# Altium schematic sheet Solenoid-Sheet.SchDoc
size 420 x 297 mm; SheetNumber: 5; SheetTotal: 5
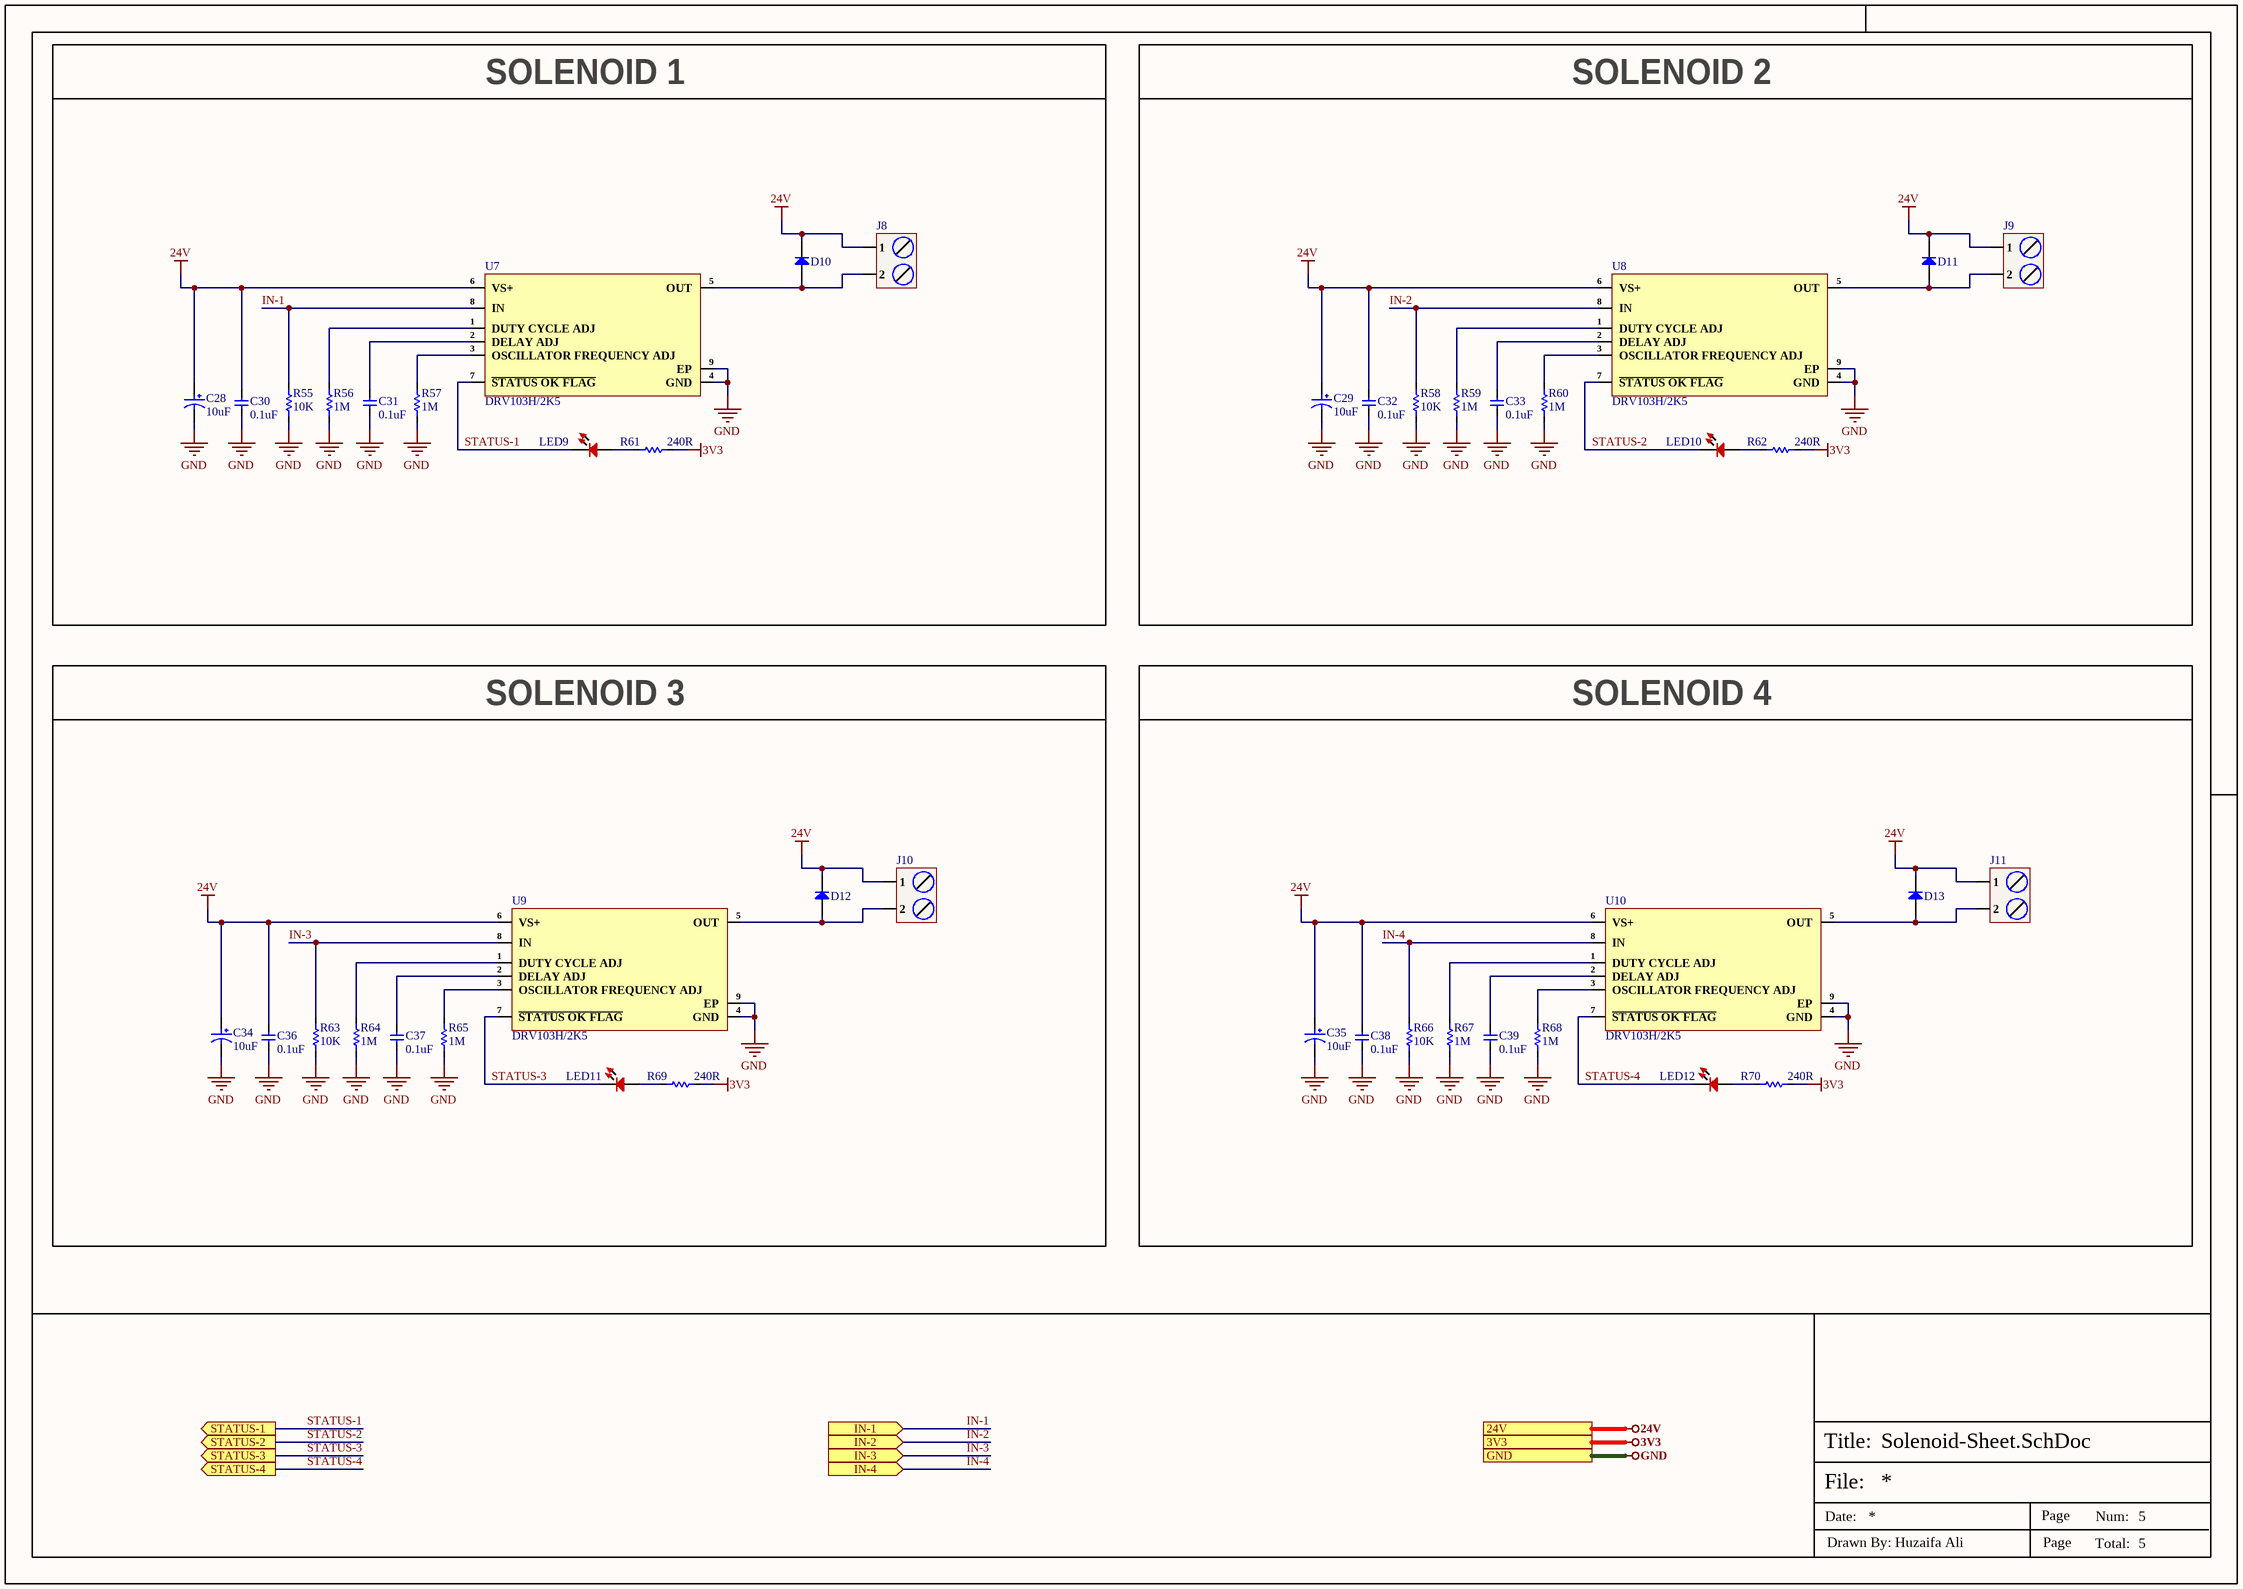
[diagram p0: Solenoid-Sheet.SchDoc]

## Parts
C28  10uF  [50SVPF10M]
C29  10uF  [50SVPF10M]
C30  0.1uF  [Cap-0603]
C31  0.1uF  [Cap-0603]
C32  0.1uF  [Cap-0603]
C33  0.1uF  [Cap-0603]
C34  10uF  [50SVPF10M]
C35  10uF  [50SVPF10M]
C36  0.1uF  [Cap-0603]
C37  0.1uF  [Cap-0603]
C38  0.1uF  [Cap-0603]
C39  0.1uF  [Cap-0603]
D10  MURS360T3G  [SMC]  (value not drawn)
D11  MURS360T3G  [SMC]  (value not drawn)
D12  MURS360T3G  [SMC]  (value not drawn)
D13  MURS360T3G  [SMC]  (value not drawn)
J8  DB128L-5.08-2P-GY-S  [DB128L-5.08-2P-GY-S]  (value not drawn)
J9  DB128L-5.08-2P-GY-S  [DB128L-5.08-2P-GY-S]  (value not drawn)
J10  DB128L-5.08-2P-GY-S  [DB128L-5.08-2P-GY-S]  (value not drawn)
J11  DB128L-5.08-2P-GY-S  [DB128L-5.08-2P-GY-S]  (value not drawn)
LED9  RED  [LED-0603]  (value not drawn)
LED10  RED  [LED-0603]  (value not drawn)
LED11  RED  [LED-0603]  (value not drawn)
LED12  RED  [LED-0603]  (value not drawn)
R55  10K  [Res-0402]
R56  1M  [Res-0402]
R57  1M  [Res-0402]
R58  10K  [Res-0402]
R59  1M  [Res-0402]
R60  1M  [Res-0402]
R61  240R  [Res-0402]
R62  240R  [Res-0402]
R63  10K  [Res-0402]
R64  1M  [Res-0402]
R65  1M  [Res-0402]
R66  10K  [Res-0402]
R67  1M  [Res-0402]
R68  1M  [Res-0402]
R69  240R  [Res-0402]
R70  240R  [Res-0402]
U7  DRV103H/2K5  [8-SO PowerPad]
U8  DRV103H/2K5  [8-SO PowerPad]
U9  DRV103H/2K5  [8-SO PowerPad]
U10  DRV103H/2K5  [8-SO PowerPad]

## Blocks framed on the sheet
SOLENOID 1: C28 C30 C31 D10 J8 LED9 R55-R57 R61 U7
SOLENOID 2: C29 C32 C33 D11 J9 LED10 R58-R60 R62 U8
SOLENOID 3: C34 C36 C37 D12 J10 LED11 R63-R65 R69 U9
SOLENOID 4: C35 C38 C39 D13 J11 LED12 R66-R68 R70 U10

## Ports
3V3 (see Top-Sheet[5B], Comms-Sheet[4D], Controller-Sheet[4D], Power-Sheet[4D]), 24V (see Top-Sheet[5B], Power-Sheet[4D]), GND (see Top-Sheet[5B], Comms-Sheet[4D], Controller-Sheet[4D], Power-Sheet[4D]), IN-1 (in, see Top-Sheet[4B]), IN-2 (in, see Top-Sheet[4B]), IN-3 (in, see Top-Sheet[4B]), IN-4 (in, see Top-Sheet[4B]), STATUS-1 (out, see Top-Sheet[4B]), STATUS-2 (out, see Top-Sheet[4B]), STATUS-3 (out, see Top-Sheet[4B]), STATUS-4 (out, see Top-Sheet[4B])

## Nets
3V3: R61.2 R62.2 R69.2 R70.2 ; port 3V3
24V: C28.1 C29.1 C30.2 C32.2 C34.1 C35.1 C36.2 C38.2 D10.1(K) D11.1(K) D12.1(K) D13.1(K) J8.1 J9.1 J10.1 J11.1 U7.6(VS+) U8.6(VS+) U9.6(VS+) U10.6(VS+) ; port 24V
GND: C28.2 C29.2 C30.1 C31.1 C32.1 C33.1 C34.2 C35.2 C36.1 C37.1 C38.1 C39.1 R55.1 R56.1 R57.1 R58.1 R59.1 R60.1 R63.1 R64.1 R65.1 R66.1 R67.1 R68.1 U7.4(GND) U7.9(EP) U8.4(GND) U8.9(EP) U9.4(GND) U9.9(EP) U10.4(GND) U10.9(EP) ; port GND
IN-1: R55.2 U7.8(IN) ; port IN-1
IN-2: R58.2 U8.8(IN) ; port IN-2
IN-3: R63.2 U9.8(IN) ; port IN-3
IN-4: R66.2 U10.8(IN) ; port IN-4
STATUS-1: LED9.2 U7.7(~{STATUS_OK_FLAG}) ; port STATUS-1
STATUS-2: LED10.2 U8.7(~{STATUS_OK_FLAG}) ; port STATUS-2
STATUS-3: LED11.2 U9.7(~{STATUS_OK_FLAG}) ; port STATUS-3
STATUS-4: LED12.2 U10.7(~{STATUS_OK_FLAG}) ; port STATUS-4
NetC31_2: C31.2 U7.2(DELAY_ADJ)
NetC33_2: C33.2 U8.2(DELAY_ADJ)
NetC37_2: C37.2 U9.2(DELAY_ADJ)
NetC39_2: C39.2 U10.2(DELAY_ADJ)
NetD10_2: D10.2(A) J8.2 U7.5(OUT)
NetD11_2: D11.2(A) J9.2 U8.5(OUT)
NetD12_2: D12.2(A) J10.2 U9.5(OUT)
NetD13_2: D13.2(A) J11.2 U10.5(OUT)
NetLED9_1: LED9.1 R61.1
NetLED10_1: LED10.1 R62.1
NetLED11_1: LED11.1 R69.1
NetLED12_1: LED12.1 R70.1
NetR56_2: R56.2 U7.1(DUTY_CYCLE_ADJ)
NetR57_2: R57.2 U7.3(OSCILLATOR_FREQUENCY_ADJ)
NetR59_2: R59.2 U8.1(DUTY_CYCLE_ADJ)
NetR60_2: R60.2 U8.3(OSCILLATOR_FREQUENCY_ADJ)
NetR64_2: R64.2 U9.1(DUTY_CYCLE_ADJ)
NetR65_2: R65.2 U9.3(OSCILLATOR_FREQUENCY_ADJ)
NetR67_2: R67.2 U10.1(DUTY_CYCLE_ADJ)
NetR68_2: R68.2 U10.3(OSCILLATOR_FREQUENCY_ADJ)

## Notes on the sheet
- File:
- Title:
- Date:
- Page
- Num:
- Total:
- Drawn By: Huzaifa Ali

## Library data of the parts
C28 C29 C34 C35 = 50SVPF10M: CAP ALUM POLY 10UF 20% 50V SMD; Manufacturer: Panasonic; Material: 4242ConductorMaterial; Item Type: Capacitor; Supplier: Mouser; Supplier Part Number: 667-50SVPF10M; Manufacturer Part Number: 50SVPF10M; RoHS: Yes; Category: Polymer Capacitors; Stock: 29802; Pricing: 1=1.12, 10=0.801, 50=0.801, 100=0.665, 1000=0.555, 10000=0.504 (USD); ComponentLink1URL: https://datasheet.ciiva.com/48542/svpf-eng-ds-48542427.pdf?src-supplier=Distrelec; ComponentLink1Description: https://datasheet.ciiva.com/48542/svpf-eng-ds-48542427.pdf?src-supplier=Distrelec; ComponentLink2URL: https://datasheet.ciiva.com/24216/svpf-os-262415-24216043.pdf?src-supplier=Mouser; ComponentLink2Description: https://datasheet.ciiva.com/24216/svpf-os-262415-24216043.pdf?src-supplier=Mouser; ComponentLink3URL: https://datasheet.ciiva.com/25761/1734360-25761263.pdf?src-supplier=Farnell; ComponentLink3Description: https://datasheet.ciiva.com/25761/1734360-25761263.pdf?src-supplier=Farnell; LCSC Part Number: C2162323
C30-C33 C36-C39 = CL10B104KB8WPNC: CAP CER 0.1UF 50V X7R 0603; Item Type: Capacitor; Material: 4241ConductorMaterial; Value: 100nF; Tolerance: 10%; LCSC Part Number: C307348; ComponentLink1Description: LCSC; Supplier: Rs; Supplier Part Number: 2575919; RoHS: Yes; Category: Ceramic Capacitors; Stock: 400; Pricing: 100=0.021, 500=0.019, 1000=0.015, 2000=0.01 (GBP); Mounting Technology: Surface Mount; Case/Package: 0603; Case Code (Metric): 1608; Case Code (Imperial): 0603; Min Operating Temperature: -55°C; Max Operating Temperature: 125°C; Packaging: Cut Tape; Voltage Rating: 50V; Series: CL; Voltage Rating (DC): 50V; Height: 900um; Ratings: AEC-Q200; RoHS Compliant: Yes; Lead Free: 5697LeadFree; ComponentLink2URL: http://www.farnell.com/datasheets/2710560.pdf?src-supplier=Farnell; ComponentLink2Description: http://www.farnell.com/datasheets/2710560.pdf?src-supplier=Farnell; ComponentLink3URL: http://www.samsungsem.com/kr/support/product-search/mlcc/CL10B104KB8WPNC.jsp?src-supplier=Digi-Key; ComponentLink3Description: http://www.samsungsem.com/kr/support/product-search/mlcc/CL10B104KB8WPNC.jsp?src-supplier=Digi-Key; ComponentLink4URL: http://www.farnell.com/datasheets/2710560.pdf?src-supplier=Element14; ComponentLink4Description: http://www.farnell.com/datasheets/2710560.pdf?src-supplier=Element14; ComponentLink5URL: https://datasheet.octopart.com/CL10B104KB8WPNC-Samsung-Electro-Mechanics-datasheet-120093645.pdf?src-supplier=Future+Electronics; ComponentLink5Description: https://datasheet.octopart.com/CL10B104KB8WPNC-Samsung-Electro-Mechanics-datasheet-120093645.pdf?src-supplier=Future+Electronics; ComponentLink6URL: http://www.farnell.com/datasheets/2710560.pdf?src-supplier=Newark; ComponentLink6Description: http://www.farnell.com/datasheets/2710560.pdf?src-supplier=Newark; ComponentLink7URL: http://www.samsungsem.com/servlet/FileDownload?type=spec&file=CL10B104KB8WPNC.pdf&src-supplier=Avnet; ComponentLink7Description: http://www.samsungsem.com/servlet/FileDownload?type=spec&file=CL10B104KB8WPNC.pdf&src-supplier=Avnet; ComponentLink8URL: https://datasheet.octopart.com/CL10B104KB8WPNC-Samsung-datasheet-8326407.pdf?src-supplier=TME; ComponentLink8Description: https://datasheet.octopart.com/CL10B104KB8WPNC-Samsung-datasheet-8326407.pdf?src-supplier=TME
D10-D13 = MURS360T3G: SMC(DO-214AB) Diodes - Fast Recovery Rectifiers ROHS; Manufacturer: FUXINSEMI; Manufacturer Part Number: MURS360T3G; Package: SMC(DO-214AB); LCSC Part Number: C7436549; Item Type: Diodes; ComponentLink1Description: LCSC; ComponentLink1URL: https://www.lcsc.com/product-detail/Diodes-Fast-Recovery-Rectifiers_FUXINSEMI-MURS360T3G_C7436549.html
J8-J11 = DB128L-5.08-2P-GY-S: 1x2P 20A -40℃~+105℃ 300V Gray 12~30 Straight 5.08mm 1~2.5 1 2 Plugin,P=5.08mm Screw terminal ROHS; Manufacturer: DORABO; Item Type: Terminal Block; Manufacturer Part Number: DB128L-5.08-2P-GY-S; Package: Plugin,P=5.08mm; LCSC Part Number: C500021; ComponentLink1Description: LCSC; ComponentLink1URL: https://www.lcsc.com/product-detail/Screw-terminal_DORABO-DB128L-5-08-2P-GY-S_C500021.html
LED9-LED12 = NCD0603R3: RED LED 0603 Light Emitting Diodes; Manufacturer: Foshan NationStar Optoelectronics; Manufacturer Part Number: NCD0603R3; Package: 0603; Item Type: LED; LCSC Part Number: C3151730; ComponentLink1Description: LCSC; ComponentLink1URL: https://www.lcsc.com/product-detail/Light-Emitting-Diodes-LED_Foshan-NationStar-Optoelectronics-NCD0603R3_C3151730.html
R55 R58 R63 R66 = RC0402FR-0710KL: RES 10K OHM 1% 1/16W 0402; Manufacturer: Yageo; Resistance: 10kR; Voltage Rating (DC): 50V; Temperature Coefficient: 100ppm/°C; Power Rating: 62.5mW; Max Power Dissipation: 63mW; Item Type: Resistor; Supplier 1: Mouser; Manufacturer Part Number: RC0402FR-0710KL; RoHS: Yes; Category: Chip SMD Resistors; Stock 1: 18648329; Pricing 1: 1=0.10000, 10=0.01400, 50=0.01400, 100=0.00500, 1000=0.00300, 10000=0.00200 (USD); Case/Package: 0402; Number of Pins: 2; Case Code (Imperial): 0402; Case Code (Metric): 1005; Min Operating Temperature: -55°C; Max Operating Temperature: 155°C; Resistor Type: Thick Film; Tolerance: 1%; Packaging: Tape and Reel; Voltage Rating: 50V; Termination: SMD/SMT; Working Voltage: 50V; Number of Terminations: 2; Features: Moisture Resistant; Series: RC; Resistance Tolerance: 1%; Construction: Rectangular; Length: 1mm; Width: 0.5mm; Height: 0.32mm; Depth: 0.5mm; Lead Pitch: 0.2mm; REACH SVHC: No SVHC; Lead Free: Lead Free; RoHS Compliant: Yes; Military Standard: Not; ComponentLink1URL: https://datasheet.ciiva.com/7660/38568-7660787.pdf?src-supplier=Element14; ComponentLink1Description: https://datasheet.ciiva.com/7660/38568-7660787.pdf?src-supplier=Element14; ComponentLink2URL: https://datasheet.ciiva.com/7849/1686128-7849814.pdf?src-supplier=Element14; ComponentLink2Description: https://datasheet.ciiva.com/7849/1686128-7849814.pdf?src-supplier=Element14; ComponentLink3URL: https://datasheet.ciiva.com/7983/1018594-7983486.pdf?src-supplier=Element14; ComponentLink3Description: https://datasheet.ciiva.com/7983/1018594-7983486.pdf?src-supplier=Element14; ComponentLink4URL: https://datasheet.ciiva.com/22747/1018594-22747512.pdf?src-supplier=Element14; ComponentLink4Description: https://datasheet.ciiva.com/22747/1018594-22747512.pdf?src-supplier=Element14; ComponentLink5URL: https://datasheet.ciiva.com/12667/pyu-rc0402-51-rohs-l-6-r-12667067.pdf?src-supplier=Mouser; ComponentLink5Description: https://datasheet.ciiva.com/12667/pyu-rc0402-51-rohs-l-6-r-12667067.pdf?src-supplier=Mouser; ComponentLink6URL: https://datasheet.ciiva.com/7849/1784430-7849813.pdf?src-supplier=Element14; ComponentLink6Description: https://datasheet.ciiva.com/7849/1784430-7849813.pdf?src-supplier=Element14; ComponentLink7URL: https://datasheet.ciiva.com/7849/1784430-7849815.pdf?src-supplier=Element14; ComponentLink7Description: https://datasheet.ciiva.com/7849/1784430-7849815.pdf?src-supplier=Element14; Supplier Part Number 1: 603-RC0402FR-0710KL; LCSC Part Number: C60490
R56 R57 R59 R60 R64 R65 R67 R68 = RC0402FR-071ML: RES 1M OHM 1% 1/16W 0402; Manufacturer: Yageo; Value: 1MR; Power Rating: 63mW; Voltage Rating: 50V; Temperature Coefficient: 100ppm/°C; Item Type: Resistor; Supplier: Digikey; Supplier Part Number: 311-1.00MLRCT-ND; Manufacturer Part Number: RC0402FR-071ML; RoHS: Yes; Category: Chip SMD Resistors; Stock: 6516; Pricing: 1=0.1, 10=0.015, 50=0.0088, 100=0.0073, 500=0.00488, 1000=0.00417, 5000=0.00297 (USD); Case/Package: 0402; Case Code (Imperial): 0402; Case Code (Metric): 1005; Min Operating Temperature: -55°C; Max Operating Temperature: 155°C; Resistor Type: Thick Film; Packaging: Tape and Reel; Tolerance: 1%; Termination: SMD/SMT; Features: Moisture Resistant; Series: RC; Max Power Dissipation: 63mW; Number of Terminations: 2; Resistance Tolerance: 1%; Construction: Rectangular; Technology: THICK FILM; Voltage Rating (AC): 50V; Length: 1mm; Height: 0.32mm; Depth: 0.5mm; RoHS Compliant: Yes; Military Standard: Not; Reach SVHC Compliant: Unknown; Lead Free: 5697LeadFree; ComponentLink1URL: https://datasheet.ciiva.com/11808/0900766b80c66297-11808125.pdf?src-supplier=Rs; ComponentLink1Description: https://datasheet.ciiva.com/11808/0900766b80c66297-11808125.pdf?src-supplier=Rs; ComponentLink2URL: https://datasheet.ciiva.com/46394/1018594-46394951.pdf?src-supplier=Element14; ComponentLink2Description: https://datasheet.ciiva.com/46394/1018594-46394951.pdf?src-supplier=Element14; ComponentLink3URL: https://datasheet.ciiva.com/7849/1018594-7849883.pdf?src-supplier=Element14; ComponentLink3Description: https://datasheet.ciiva.com/7849/1018594-7849883.pdf?src-supplier=Element14; ComponentLink4URL: https://datasheet.ciiva.com/7849/1018594-7849882.pdf?src-supplier=Element14; ComponentLink4Description: https://datasheet.ciiva.com/7849/1018594-7849882.pdf?src-supplier=Element14; ComponentLink5URL: https://datasheet.ciiva.com/16741/pyu-rc0402-51-rohs-l-6-r-16741081.pdf?src-supplier=Future+Electronics; ComponentLink5Description: https://datasheet.ciiva.com/16741/pyu-rc0402-51-rohs-l-6-r-16741081.pdf?src-supplier=Future+Electronics; LCSC Part Number: C138033
R61 R62 R69 R70 = RC0402FR-07240RL: RES 240 OHM 1% 1/16W 0402; Manufacturer: Yageo; Item Type: Resistors; Power Rating: 63mW; Temperature Coefficient: 100ppm/°C; Voltage Rating (DC): 50V; Supplier 1: Mouser; Manufacturer Part Number: RC0402FR-07240RL; RoHS: Yes; Stock 1: 1903202; Pricing 1: 1=0.10000, 10=0.01200, 50=0.01200, 100=0.00500, 1000=0.00300, 10000=0.00100 (USD); Case/Package: 0402; Case Code (Metric): 1005; Case Code (Imperial): 0402; Size Code: 0402; Min Operating Temperature: -55°C; Max Operating Temperature: 155°C; Resistance: 240R; Tolerance: 1%; Packaging: Tape and Reel; Resistor Type: Thick Film; Voltage Rating: 50V; Package Quantity: 1; Number of Terminations: 2; Termination: SMD/SMT; Max Power Dissipation: 63mW; Features: Moisture Resistant; Series: RC; Construction: Rectangular; Resistance Tolerance: 1%; Length: 1mm; Width: 0.02inch; Height: 0.016inch; Depth: 0.5mm; REACH SVHC: Unknown; Lead Free: Lead Free; RoHS Compliant: Yes; Military Standard: Not; ComponentLink1URL: https://datasheet.ciiva.com/7849/1018594-7849915.pdf?src-supplier=Element14; ComponentLink1Description: https://datasheet.ciiva.com/7849/1018594-7849915.pdf?src-supplier=Element14; ComponentLink2URL: https://datasheet.ciiva.com/7849/1018594-7849916.pdf?src-supplier=Element14; ComponentLink2Description: https://datasheet.ciiva.com/7849/1018594-7849916.pdf?src-supplier=Element14; ComponentLink3URL: https://datasheet.ciiva.com/2519/pyu-r-int-thick-7-2519157.pdf?src-supplier=Digi-Key; ComponentLink3Description: https://datasheet.ciiva.com/2519/pyu-r-int-thick-7-2519157.pdf?src-supplier=Digi-Key; ComponentLink4URL: https://datasheet.ciiva.com/2519/pyu-r-int-thick-7-2519158.pdf?src-supplier=Digi-Key; ComponentLink4Description: https://datasheet.ciiva.com/2519/pyu-r-int-thick-7-2519158.pdf?src-supplier=Digi-Key; ComponentLink5URL: https://datasheet.ciiva.com/2519/pyu-r-int-thick-7-2519156.pdf?src-supplier=Digi-Key; ComponentLink5Description: https://datasheet.ciiva.com/2519/pyu-r-int-thick-7-2519156.pdf?src-supplier=Digi-Key; ComponentLink6URL: https://datasheet.ciiva.com/12669/pyu-rc0402-51-rohs-l-6-r-12669689.pdf?src-supplier=Mouser; ComponentLink6Description: https://datasheet.ciiva.com/12669/pyu-rc0402-51-rohs-l-6-r-12669689.pdf?src-supplier=Mouser; ComponentLink7URL: https://datasheet.ciiva.com/17419/pyu-rc0402-51-rohs-l-6-r-17419482.pdf?src-supplier=Future+Electronics; ComponentLink7Description: https://datasheet.ciiva.com/17419/pyu-rc0402-51-rohs-l-6-r-17419482.pdf?src-supplier=Future+Electronics; Supplier Part Number 1: 603-RC0402FR-07240RL; LCSC Part Number: C114755
U7-U10 = DRV103H/2K5: IC PWR DRVR N-CHAN 1:1 8SOPWRPAD; Manufacturer: Texas Instruments; Number of Channels: 1NUMBER; Supplier: Mouser; LCSC Part Number: C544418; Manufacturer Part Number: DRV103H/2K5; RoHS: Yes; Item Type: IC; Stock: 2092; Pricing: 1=4.53, 10=3.85, 50=3.85, 100=3.33, 1000=2.39, 10000=2.24 (USD); Length: 4.89mm; Width: 3.9mm; Height: 1.7mm; Thickness: 1.48mm; Lead Free: 5697LeadFree; RoHS Compliant: 5897YesNo; ComponentLink1URL: https://datasheet.ciiva.com/15110/getdatasheetpartid-547625-15110691.pdf?src-supplier=Verical; ComponentLink1Description: https://datasheet.ciiva.com/15110/getdatasheetpartid-547625-15110691.pdf?src-supplier=Verical; ComponentLink2URL: https://datasheet.ciiva.com/1958/drv103-1958756.pdf?src-supplier=Digikey; ComponentLink2Description: https://datasheet.ciiva.com/1958/drv103-1958756.pdf?src-supplier=Digikey; ComponentLink3URL: https://datasheet.ciiva.com/1958/drv103-1958757.pdf?src-supplier=Digikey; ComponentLink3Description: https://datasheet.ciiva.com/1958/drv103-1958757.pdf?src-supplier=Digikey; ComponentLink4URL: https://datasheet.ciiva.com/1958/drv103-1958758.pdf?src-supplier=Digikey; ComponentLink4Description: https://datasheet.ciiva.com/1958/drv103-1958758.pdf?src-supplier=Digikey